# Altium schematic sheet Buck Converters.SchDoc
size B; SheetNumber: 3; SheetTotal: 3
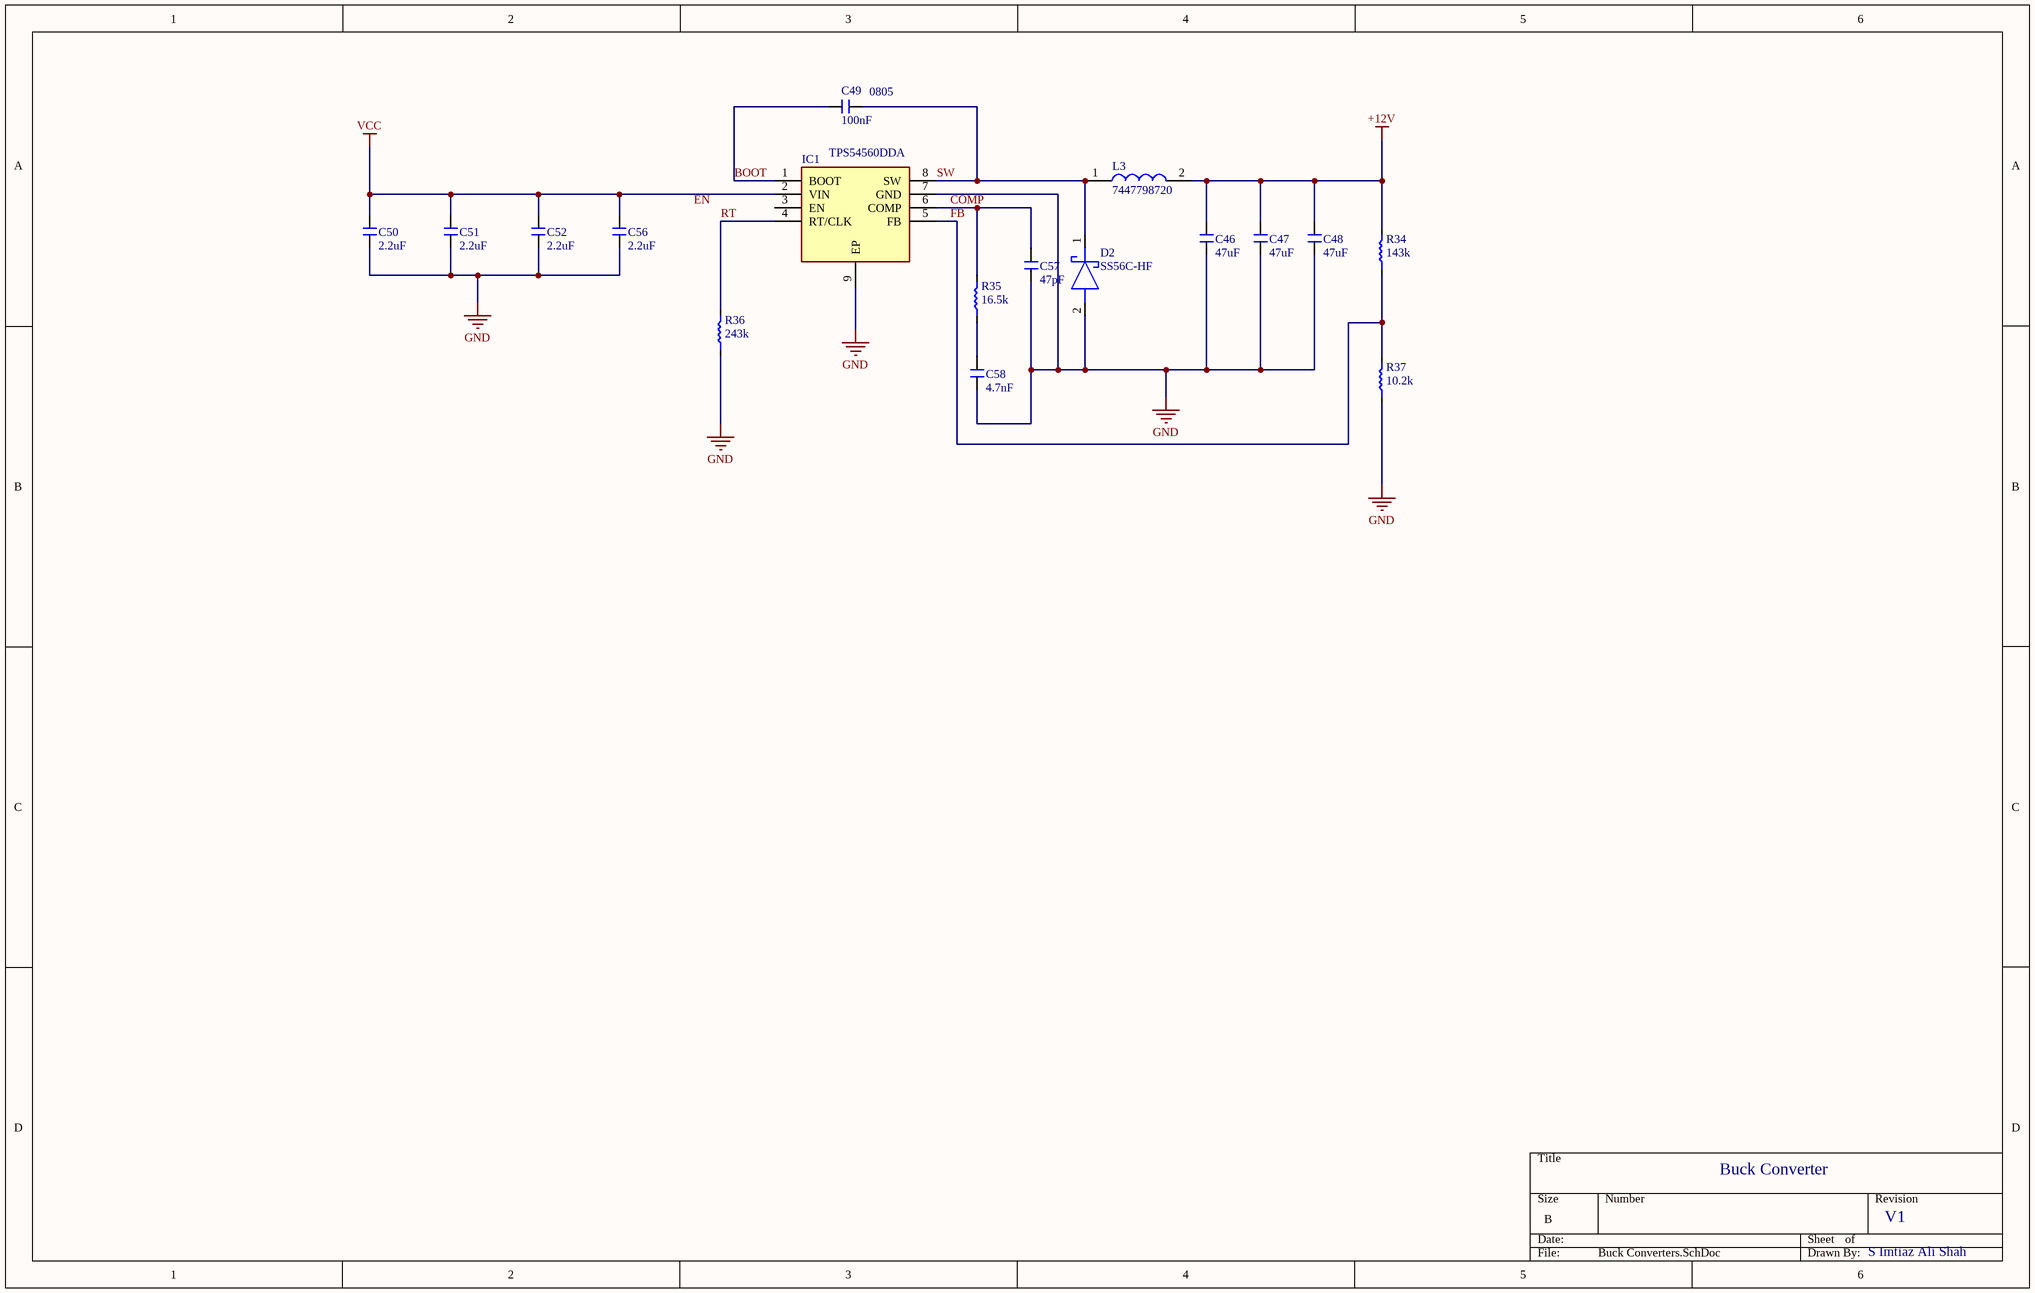
[diagram p0: Buck Converters.SchDoc]

## Parts
C46  47uF  [C_0603]
C47  47uF  [C_0603]
C48  47uF  [C_0603]
C49  100nF  [C_0603]
C50  2.2uF  [C_0603]
C51  2.2uF  [C_0603]
C52  2.2uF  [C_0603]
C56  2.2uF  [C_0603]
C57  47pF  [C_0402]
C58  4.7nF  [C_0402]
D2  SS56C-HF  [DIOM7859X239N]
IC1  TPS54560DDA  [SOIC127P600X170-9N]
L3  7447798720  [7447797360]
R34  143k  [R_0402]
R35  16.5k  [R_0402]
R36  243k  [R_0402]
R37  10.2k  [R_0402]

## Nets
+12V: C46.1 C47.1 C48.1 L3.2 R34.1
GND: C46.2 C47.2 C48.2 C50.2 C51.2 C52.2 C56.2 C57.2 C58.2 D2.2(A) IC1.7(GND) IC1.9(EP) R36.2 R37.2
VCC: C50.1 C51.1 C52.1 C56.1 IC1.2(VIN)
BOOT: C49.1 IC1.1(BOOT)
COMP: C57.1 IC1.6(COMP) R35.1
FB: IC1.5(FB) R34.2 R37.1
RT: IC1.4(RT/CLK) R36.1
SW: C49.2 D2.1(K) IC1.8(SW) L3.1
NetC58_1: C58.1 R35.2

Not connected (* = marked no-connect by the designer): IC1 3(EN)

## Notes on the sheet
- (near C49) 0805
- Buck Converter
- V1
- S Imtiaz Ali Shah
- Labels drawn without touching a wire or pin: EN

## Library data of the parts
C46-C52 C56 = C_0603
C57 C58 = C_0402
D2 = SS56C-HF: Schottky Diode; Manufacturer_Name: Comchip Technology; Parameter 1: B560C-13-F; Parameter 2: C85100; Datasheet Link: https://www.comchiptech.com/admin/files/product/20190806171902.pdf; Height: 2.39mm; Manufacturer_Part_Number: SS56C-HF; Mouser Part Number: 750-SS56C-HF; Mouser Price/Stock: https://www.mouser.co.uk/ProductDetail/Comchip-Technology/SS56C-HF?qs=GBLSl2AkirseVC5DPICxbA%3D%3D; Arrow Part Number: SS56C-HF; Arrow Price/Stock: https://www.arrow.com/en/products/ss56c-hf/comchip-technology?region=nac
IC1 = TPS54560DDA: Integrated Circuit; Manufacturer_Name: Texas Instruments; Parameter 2: C7420431; Parameter 3: C31966; Datasheet Link: http://www.ti.com/lit/ds/symlink/tps54560.pdf; Height: 1.7mm; Manufacturer_Part_Number: TPS54560DDA; Mouser Part Number: 595-TPS54560DDA; Mouser Price/Stock: https://www.mouser.co.uk/ProductDetail/Texas-Instruments/TPS54560DDA?qs=%2FA2SZCkL4TkCDiLMkQe1zw%3D%3D; Arrow Part Number: TPS54560DDA; Arrow Price/Stock: https://www.arrow.com/en/products/tps54560dda/texas-instruments?utm_currency=USD&region=nac; Parameter 1: TPS54560DDA
L3 = 7447798720: Inductor; Manufacturer_Name: Wurth Elektronik; Height: 4.5mm; Manufacturer_Part_Number: 7447798720; Mouser Part Number: 710-7447798720; Mouser Price/Stock: https://www.mouser.co.uk/ProductDetail/Wurth-Elektronik/7447798720?qs=E%2F%2FhvbtCqpOcNhO9pFvFww%3D%3D
R34-R37 = R_0402